# EAGLE design pocket_sdr_v2.2 (EAGLE 9.6.2)
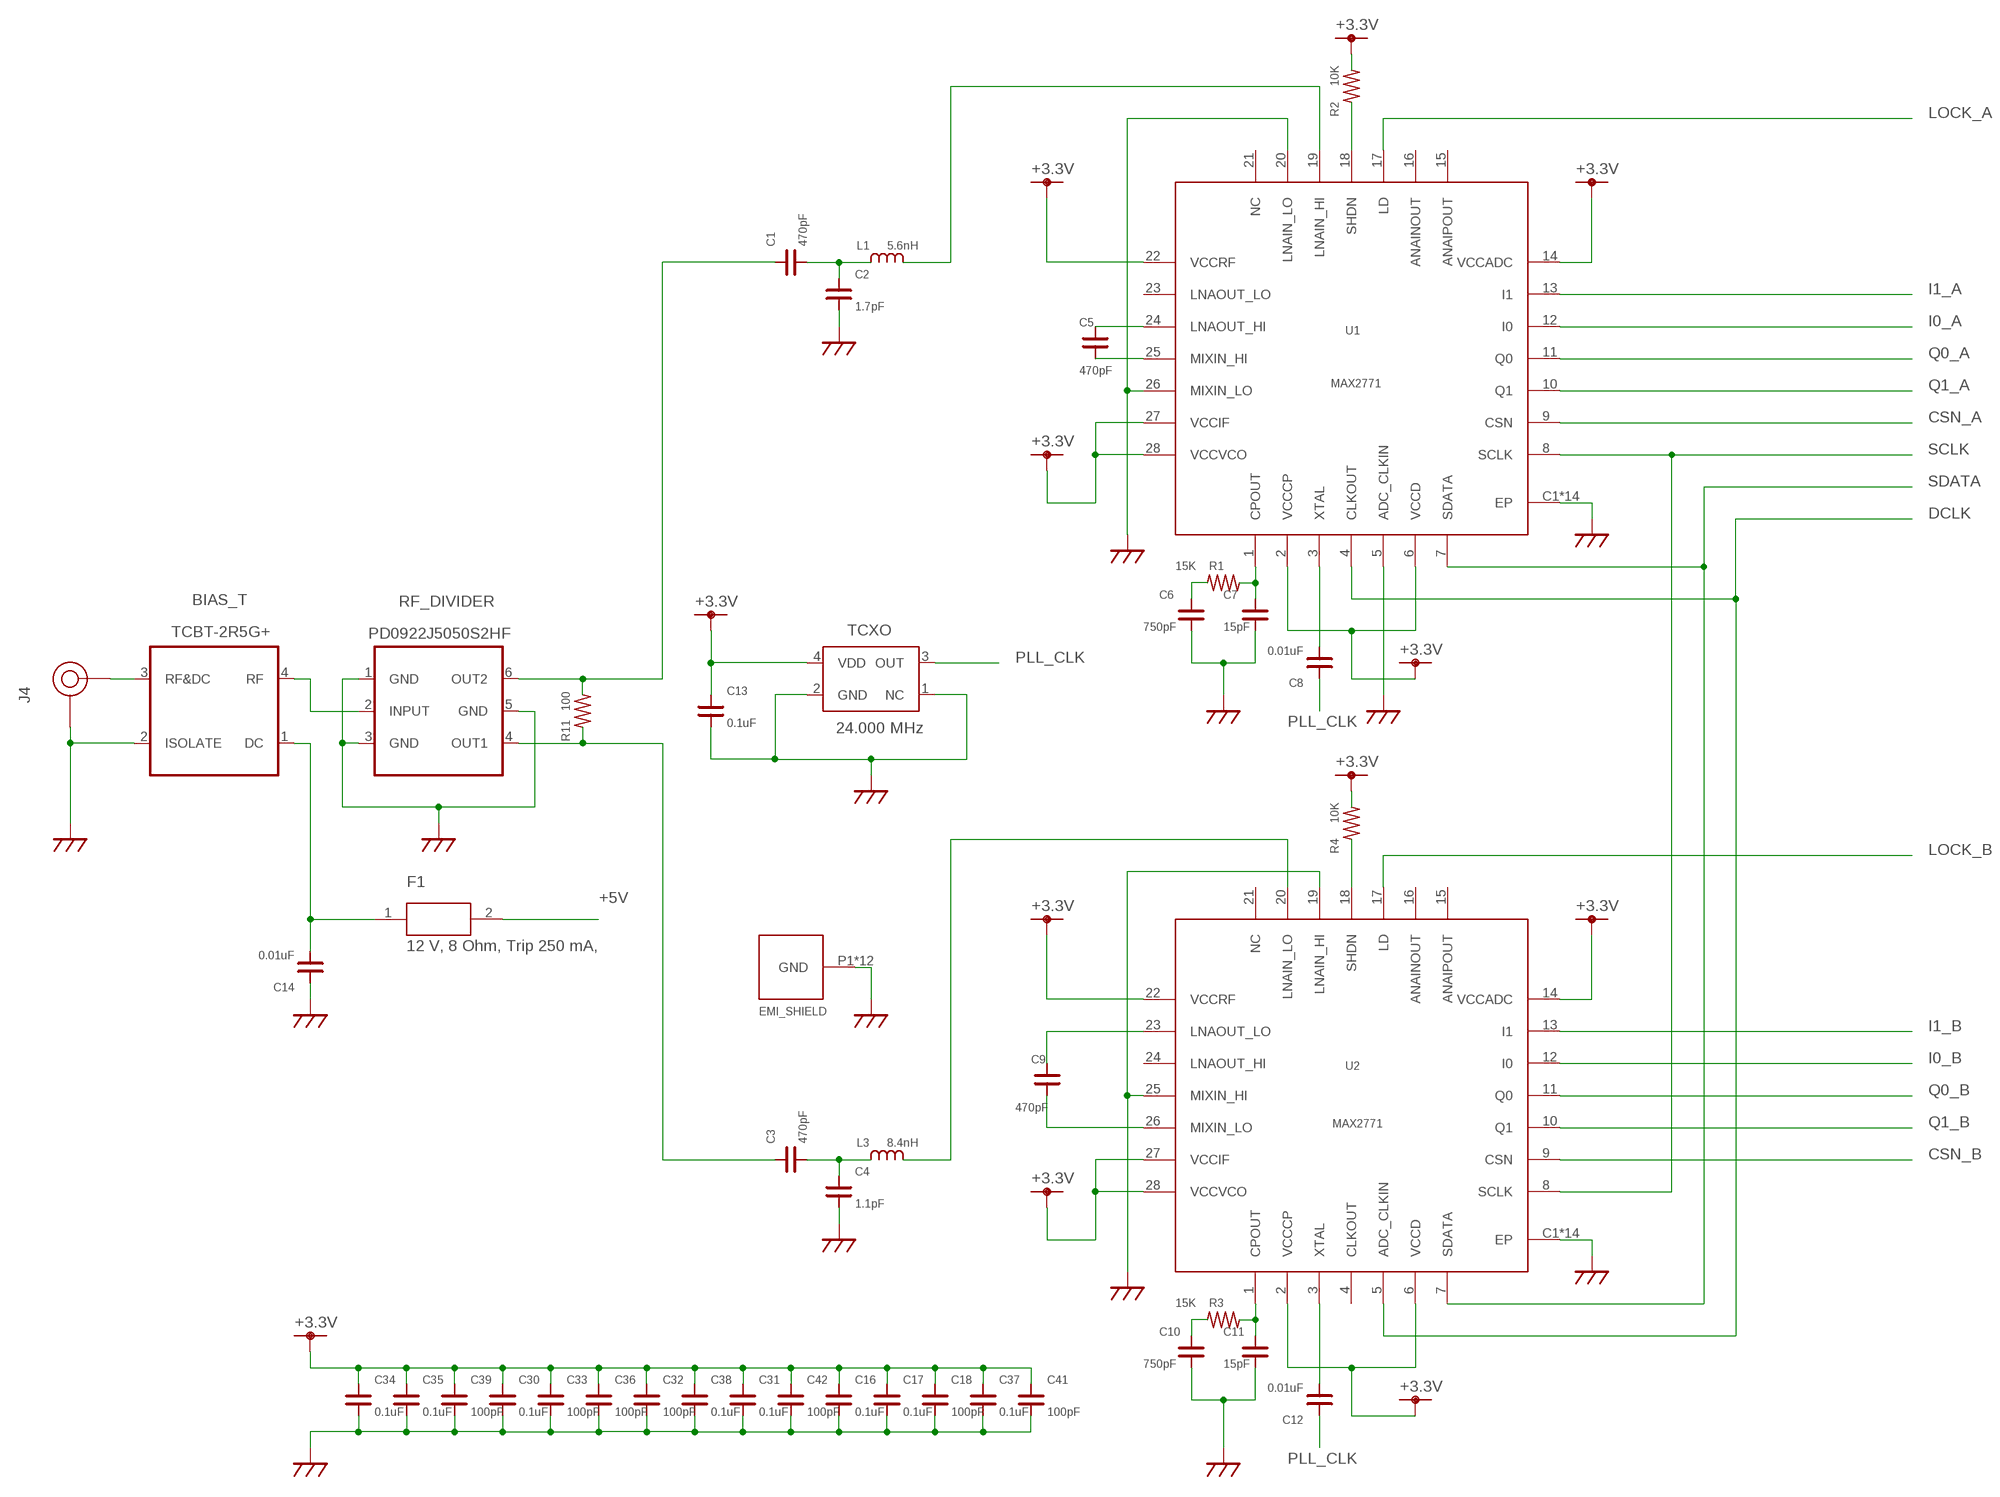
[diagram p0: schematic, sheet 1, part 1 of 2]
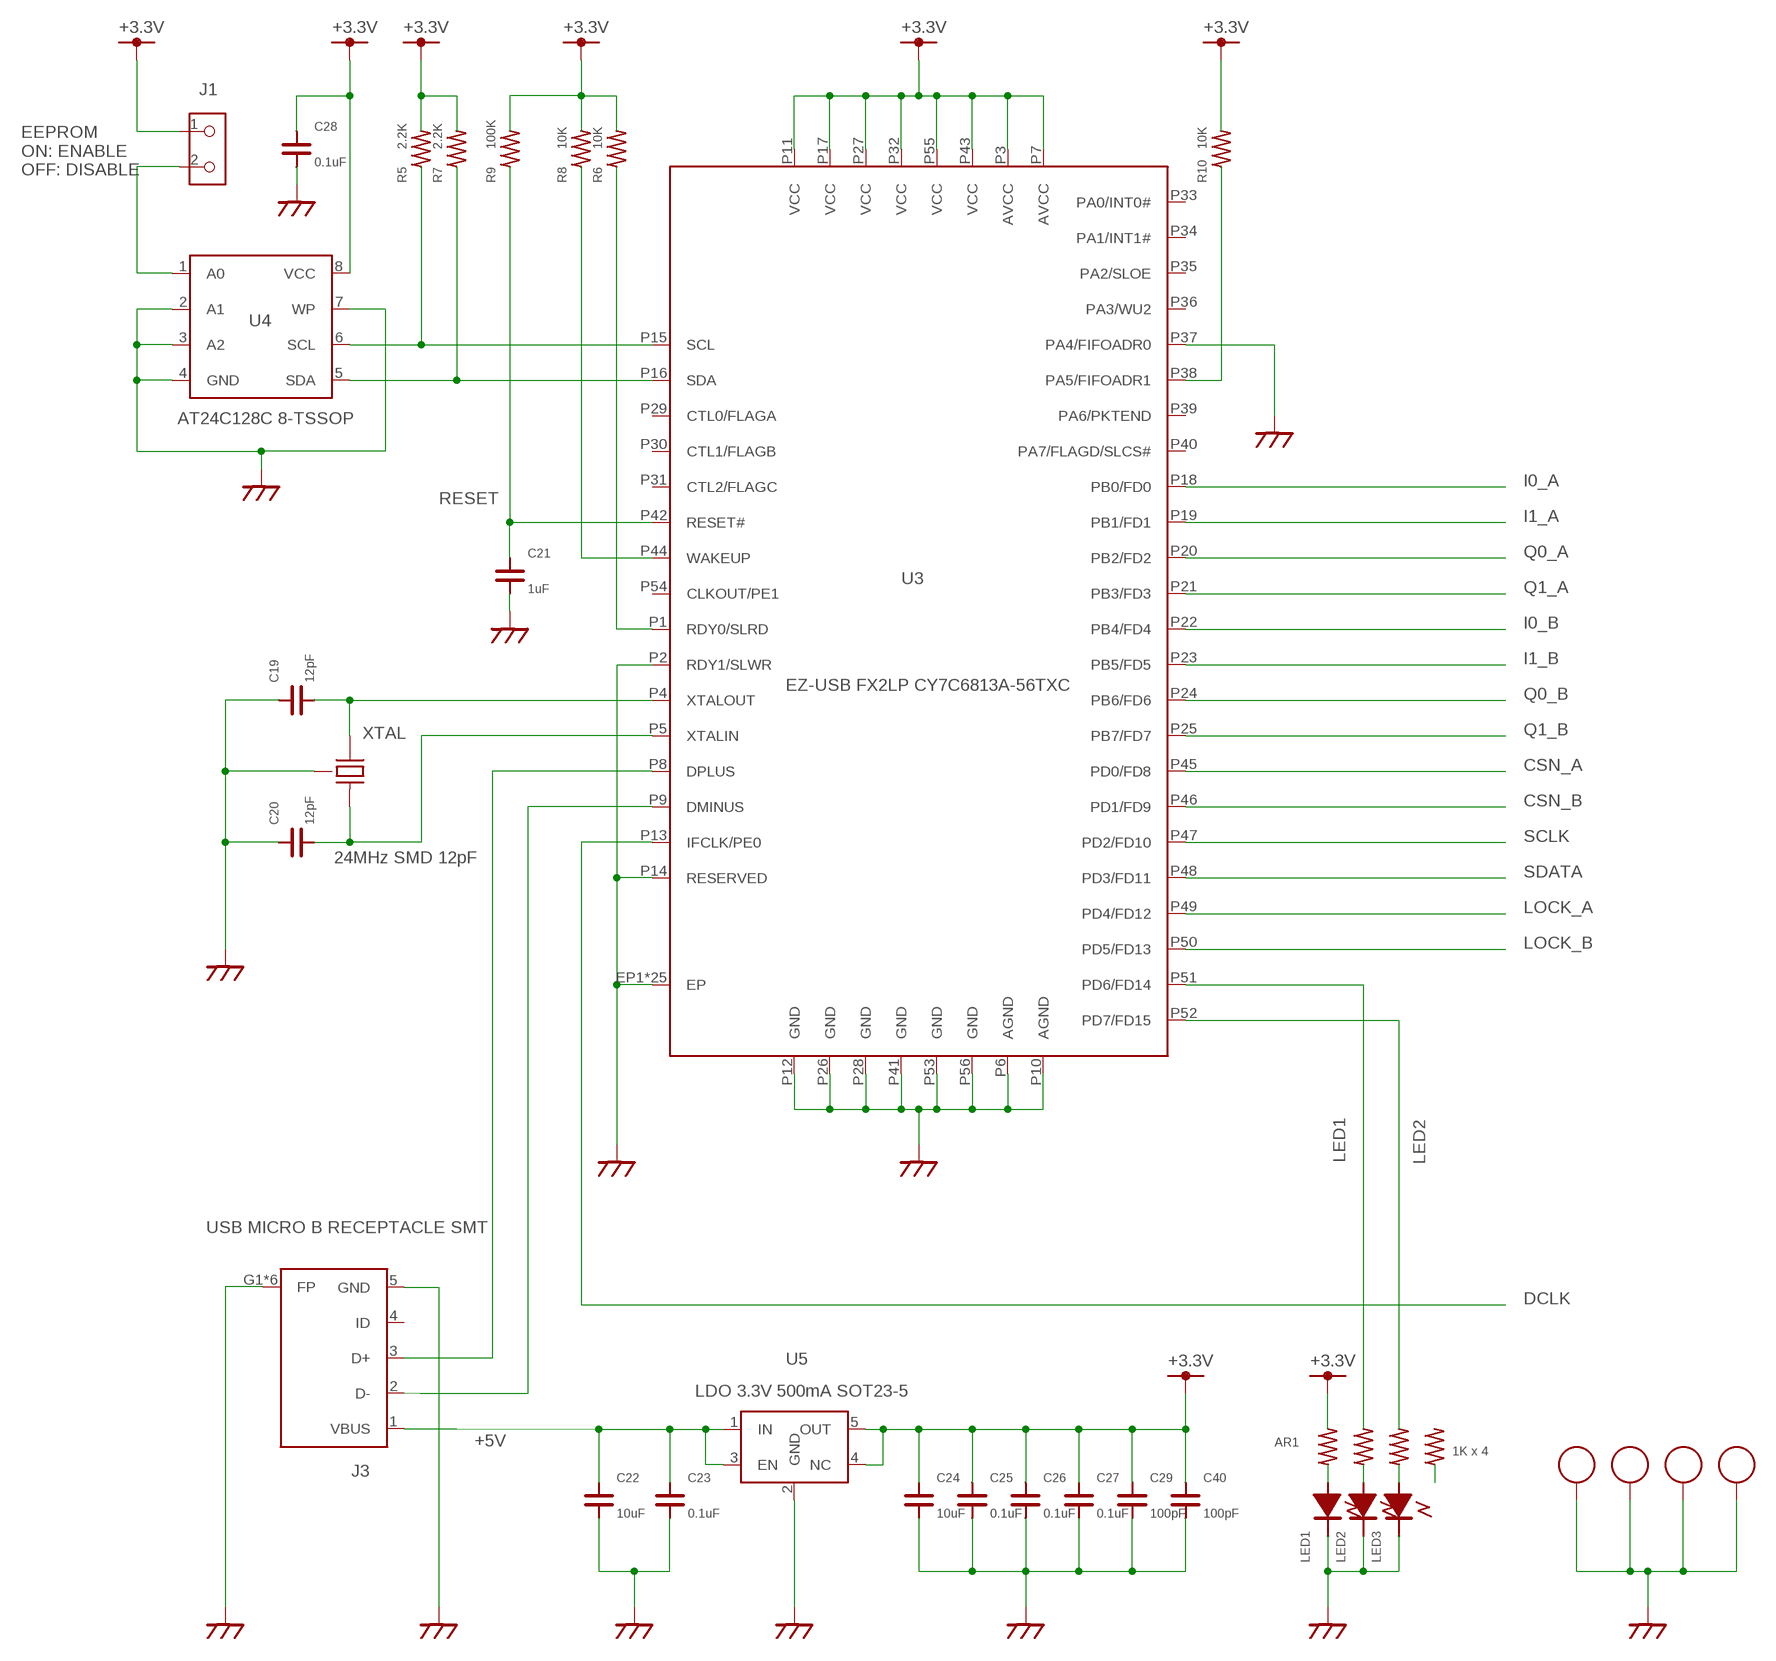
[diagram p1: schematic, sheet 1, part 2 of 2]

## Parts
AR1  1K x 4  ARRAY_REG__EXB28V  [EXB28V]
BIAS_T  TCBT-2R5G+  BIAS_T  [BIAS_T]
C1  470pF  C1005  [C1005]
C2  1.7pF  C1005  [C1005]
C3  470pF  C1005  [C1005]
C4  1.1pF  C1005  [C1005]
C5  470pF  C1005  [C1005]
C6  750pF  C1005  [C1005]
C7  15pF  C1005  [C1005]
C8  0.01uF  C1005  [C1005]
C9  470pF  C1005  [C1005]
C10  750pF  C1005  [C1005]
C11  15pF  C1005  [C1005]
C12  0.01uF  C1005  [C1005]
C13  0.1uF  C1005  [C1005]
C14  0.01uF  C1005  [C1005]
C16  0.1uF  C1005  [C1005]
C17  0.1uF  C1005  [C1005]
C18  100pF  C1005  [C1005]
C19  12pF  C1005  [C1005]
C20  12pF  C1005  [C1005]
C21  1uF  C1005  [C1005]
C22  10uF  C3225  [C3225]
C23  0.1uF  C1005  [C1005]
C24  10uF  C3225  [C3225]
C25  0.1uF  C1005  [C1005]
C26  0.1uF  C1005  [C1005]
C27  0.1uF  C1005  [C1005]
C28  0.1uF  C1005  [C1005]
C29  100pF  C1005  [C1005]
C30  0.1uF  C1005  [C1005]
C31  0.1uF  C1005  [C1005]
C32  100pF  C1005  [C1005]
C33  100pF  C1005  [C1005]
C34  0.1uF  C1005  [C1005]
C35  0.1uF  C1005  [C1005]
C36  100pF  C1005  [C1005]
C37  0.1uF  C1005  [C1005]
C38  0.1uF  C1005  [C1005]
C39  100pF  C1005  [C1005]
C40  100pF  C1005  [C1005]
C41  100pF  C1005  [C1005]
C42  100pF  C1005  [C1005]
F1  12 V, 8 Ohm, Trip 250 mA,  POLYSW1608  [C1608]
J1  PIN HEADER 2MM 2P  PINH_2MM_2P  [PINH-2MM-2P]
J3  USB MICRO B RECEPTACLE SMT  MICROUSB  [MICROUSB]
J4  SMA JACK EDGE MNT  SMA-ANG  [SMA-ANG]
L1  5.6nH  L1608  [C1608]
L3  8.4nH  L1608  [C1608]
LED1  LED1608 GREEN  LED1608  [LED_1608]
LED2  LED1608 BLUE  LED1608  [LED_1608]
LED3  LED1608 BLUE  LED1608  [LED_1608]
R1  15K  R1005  [C1005]
R2  10K  R1005  [C1005]
R3  15K  R1005  [C1005]
R4  10K  R1005  [C1005]
R5  2.2K  R1005  [C1005]
R6  10K  R1005  [C1005]
R7  2.2K  R1005  [C1005]
R8  10K  R1005  [C1005]
R9  100K  R1005  [C1005]
R10  10K  R1005  [C1005]
R11  100  R1005  [C1005]
RF-SHEILD-CASE  BMI-S-202-F BMI-S-202-C  BMI-S-202  [BMI-S-202]
RF_DIVIDER  PD0922J5050S2HF  RF_DIV  [RF_DIV]
TCXO  24.000 MHz  TCXO  [TCXO]
U1  MAX2771  [TQFN28]
U2  MAX2771  [TQFN28]
U3  EZ-USB FX2LP CY7C6813A-56TXC  CY7C6813A  [QFN56]
U4  AT24C128C 8-TSSOP  AT24C256C  [TSSOP_8P]
U5  LDO 3.3V 500mA SOT23-5  LDO_SOT  [SOT23]
U$53  CPAD_2.2MM  [CPAD_2.2MM]
U$54  CPAD_2.2MM  [CPAD_2.2MM]
U$55  CPAD_2.2MM  [CPAD_2.2MM]
U$58  CPAD_2.2MM  [CPAD_2.2MM]
XTAL  24MHz SMD 12pF  XTAL_SMD  [XTAL_SMD]

## Nets
+3.3V: AR1.2 C13.1 C16.1 C17.1 C18.1 C24.P$1 C25.1 C26.1 C27.1 C28.1 C29.1 C30.1 C31.1 C32.1 C33.1 C34.1 C35.1 C36.1 C37.1 C38.1 C39.1 C40.1 C41.1 C42.1 J1.1 R2.2 R4.2 R5.2 R6.2 R7.2 R8.2 R9.2 R10.2 TCXO.4(VDD) U1.2(VCCCP) U1.6(VCCD) U1.14(VCCADC) U1.22(VCCRF) U1.27(VCCIF) U1.28(VCCVCO) U2.2(VCCCP) U2.6(VCCD) U2.14(VCCADC) U2.22(VCCRF) U2.27(VCCIF) U2.28(VCCVCO) U3.P3(AVCC) U3.P7(AVCC) U3.P11(VCC) U3.P17(VCC) U3.P27(VCC) U3.P32(VCC) U3.P43(VCC) U3.P55(VCC) U4.8(VCC) U5.4(NC) U5.5(OUT)
+5V: C22.P$1 C23.1 F1.2 J3.1(VBUS) U5.1(IN) U5.3(EN)
CSN_A: U1.9(CSN) U3.P45(PD0/FD8)
CSN_B: U2.9(CSN) U3.P46(PD1/FD9)
DCLK: U1.4(CLKOUT) U2.5(ADC_CLKIN) U3.P13(IFCLK/PE0)
FIFOADR1: R10.1 U3.P38(PA5/FIFOADR1)
GND: BIAS_T.2(ISOLATE) C2.1 C4.2 C6.2 C7.2 C10.2 C11.2 C13.2 C14.1 C16.2 C17.2 C18.2 C19.1 C20.1 C21.2 C22.P$2 C23.2 C24.P$2 C25.2 C26.2 C27.2 C28.2 C29.2 C30.2 C31.2 C32.2 C33.2 C34.2 C35.2 C36.2 C37.2 C38.2 C39.2 C40.2 C41.2 C42.2 J3.5(GND) J3.G1(FP) J3.G2(FP) J3.G3(FP) J3.G4(FP) J3.G5(FP) J3.G6(FP) J4.P2(GND) J4.P3(GND) J4.P4(GND) J4.P5(GND) LED1.2 LED2.2 LED3.2 RF-SHEILD-CASE.P1(GND) RF-SHEILD-CASE.P2(GND) RF-SHEILD-CASE.P3(GND) RF-SHEILD-CASE.P4(GND) RF-SHEILD-CASE.P5(GND) RF-SHEILD-CASE.P6(GND) RF-SHEILD-CASE.P7(GND) RF-SHEILD-CASE.P8(GND) RF-SHEILD-CASE.P9(GND) RF-SHEILD-CASE.P10(GND) RF-SHEILD-CASE.P11(GND) RF-SHEILD-CASE.P12(GND) RF_DIVIDER.1(GND) RF_DIVIDER.3(GND) RF_DIVIDER.5(GND) TCXO.1(NC) TCXO.2(GND) U1.5(ADC_CLKIN) U1.20(LNAIN_LO) U1.26(MIXIN_LO) U1.C1(EP) U1.C2(EP) U1.C3(EP) U1.C4(EP) U1.EP U1.V1(EP) U1.V2(EP) U1.V3(EP) U1.V4(EP) U1.V5(EP) U1.V6(EP) U1.V7(EP) U1.V8(EP) U1.V9(EP) U2.19(LNAIN_HI) U2.25(MIXIN_HI) U2.C1(EP) U2.C2(EP) U2.C3(EP) U2.C4(EP) U2.EP U2.V1(EP) U2.V2(EP) U2.V3(EP) U2.V4(EP) U2.V5(EP) U2.V6(EP) U2.V7(EP) U2.V8(EP) U2.V9(EP) U3.EP1(EP) U3.EP2(EP) U3.EP3(EP) U3.EP4(EP) U3.EP5(EP) U3.P2(RDY1/SLWR) U3.P6(AGND) U3.P10(AGND) U3.P12(GND) U3.P14(RESERVED) U3.P26(GND) U3.P28(GND) U3.P37(PA4/FIFOADR0) U3.P41(GND) U3.P53(GND) U3.P56(GND) U3.P$1(EP) U3.P$2(EP) U3.P$3(EP) U3.P$4(EP) U3.P$5(EP) U3.P$6(EP) U3.P$7(EP) U3.P$8(EP) U3.P$9(EP) U3.P$10(EP) U3.P$11(EP) U3.P$12(EP) U3.P$13(EP) U3.P$14(EP) U3.P$15(EP) U3.P$16(EP) U3.P$17(EP) U3.P$18(EP) U3.P$19(EP) U3.P$20(EP) U4.2(A1) U4.3(A2) U4.4(GND) U4.7(WP) U5.2(GND) U$53.EP U$54.EP U$55.EP U$58.EP XTAL.P2(GND) XTAL.P4(GND)
I0_A: U1.12(I0) U3.P18(PB0/FD0)
I0_B: U2.12(I0) U3.P22(PB4/FD4)
I1_A: U1.13(I1) U3.P19(PB1/FD1)
I1_B: U2.13(I1) U3.P23(PB5/FD5)
LED1: AR1.4 U3.P51(PD6/FD14)
LED2: AR1.6 U3.P52(PD7/FD15)
LOCK_A: U1.17(LD) U3.P49(PD4/FD12)
LOCK_B: U2.17(LD) U3.P50(PD5/FD13)
N$1: C5.2 U1.25(MIXIN_HI)
N$2: C5.1 U1.24(LNAOUT_HI)
N$3: BIAS_T.3(RF&DC) J4.P1(RF)
N$4: BIAS_T.4(RF) RF_DIVIDER.2(INPUT)
N$5: BIAS_T.1(DC) C14.2 F1.1
N$6: R6.1 U3.P1(RDY0/SLRD)
N$8: AR1.3 LED2.1(+)
N$9: C1.2 C2.2 L1.1
N$10: C8.2 U1.3(XTAL)
N$11: AR1.7
N$12: L1.2 U1.19(LNAIN_HI)
N$13: AR1.1 LED1.1(+)
N$14: C1.1 R11.2 RF_DIVIDER.6(OUT2)
N$15: C9.2 U2.26(MIXIN_LO)
N$16: C9.1 U2.23(LNAOUT_LO)
N$17: C19.2 U3.P4(XTALOUT) XTAL.P1(XTAL1)
N$18: R2.1 U1.18(SHDN)
N$20: J3.3(D+) U3.P8(DPLUS)
N$22: C20.2 U3.P5(XTALIN) XTAL.P3(XTAL2)
N$23: AR1.5 LED3.1(+)
N$24: C7.1 R1.2 U1.1(CPOUT)
N$25: C6.1 R1.1
N$27: C11.1 R3.2 U2.1(CPOUT)
N$28: R7.1 U3.P16(SDA) U4.5(SDA)
N$29: R5.1 U3.P15(SCL) U4.6(SCL)
N$30: R8.1 U3.P44(WAKEUP)
N$32: C10.1 R3.1
N$33: J3.2(D-) U3.P9(DMINUS)
N$34: J1.2 U4.1(A0)
N$35: C3.1 R11.1 RF_DIVIDER.4(OUT1)
N$37: C3.2 C4.1 L3.1
N$38: L3.2 U2.20(LNAIN_LO)
N$42: R4.1 U2.18(SHDN)
N$43: C12.2 U2.3(XTAL)
PLL_CLK: C8.1 C12.1 TCXO.3(OUT)
Q0_A: U1.11(Q0) U3.P20(PB2/FD2)
Q0_B: U2.11(Q0) U3.P24(PB6/FD6)
Q1_A: U1.10(Q1) U3.P21(PB3/FD3)
Q1_B: U2.10(Q1) U3.P25(PB7/FD7)
RESET: C21.1 R9.1 U3.P42(RESET#)
SCLK: U1.8(SCLK) U2.8(SCLK) U3.P47(PD2/FD10)
SDATA: U1.7(SDATA) U2.7(SDATA) U3.P48(PD3/FD11)
Unconnected: AR1.8 J3.4(ID) U1.15(ANAIPOUT) U1.16(ANAINOUT) U1.21(NC) U1.23(LNAOUT_LO) U2.4(CLKOUT) U2.15(ANAIPOUT) U2.16(ANAINOUT) U2.21(NC) U2.24(LNAOUT_HI) U3.P29(CTL0/FLAGA) U3.P30(CTL1/FLAGB) U3.P31(CTL2/FLAGC) U3.P33(PA0/INT0#) U3.P34(PA1/INT1#) U3.P35(PA2/SLOE) U3.P36(PA3/WU2) U3.P39(PA6/PKTEND) U3.P40(PA7/FLAGD/SLCS#) U3.P54(CLKOUT/PE1)

## Notes on the sheet
- EEPROM
  ON: ENABLE
  OFF: DISABLE

## Library data of the parts
AR1 = ttaka_desc:ARRAY_REG__EXB28V
BIAS_T = ttaka_misc:BIAS_T
C1-C14 C16-C21 C23 C25-C42 = ttaka_desc:C1005
C22 C24 = ttaka_desc:C3225
F1 = ttaka_desc:POLYSW1608
J1 = ttaka_conn:PINH_2MM_2P
J3 = ttaka_conn:MICROUSB
J4 = ttaka_conn:SMA-ANG
L1 L3 = ublox:L1608
LED1-LED3 = ttaka_desc:LED1608
R1-R11 = ttaka_desc:R1005
RF-SHEILD-CASE = ttaka_misc:BMI-S-202
RF_DIVIDER = ttaka_misc:RF_DIV
TCXO = ttaka_misc:TCXO
U1 U2 = ttaka_ic:MAX2771
U3 = ttaka_ic:CY7C6813A
U4 = ttaka_ic:AT24C256C
U5 = ttaka_misc:LDO_SOT
U$53-U$55 U$58 = ttaka_misc:CPAD_2.2MM
XTAL = ttaka_misc:XTAL_SMD

## Board
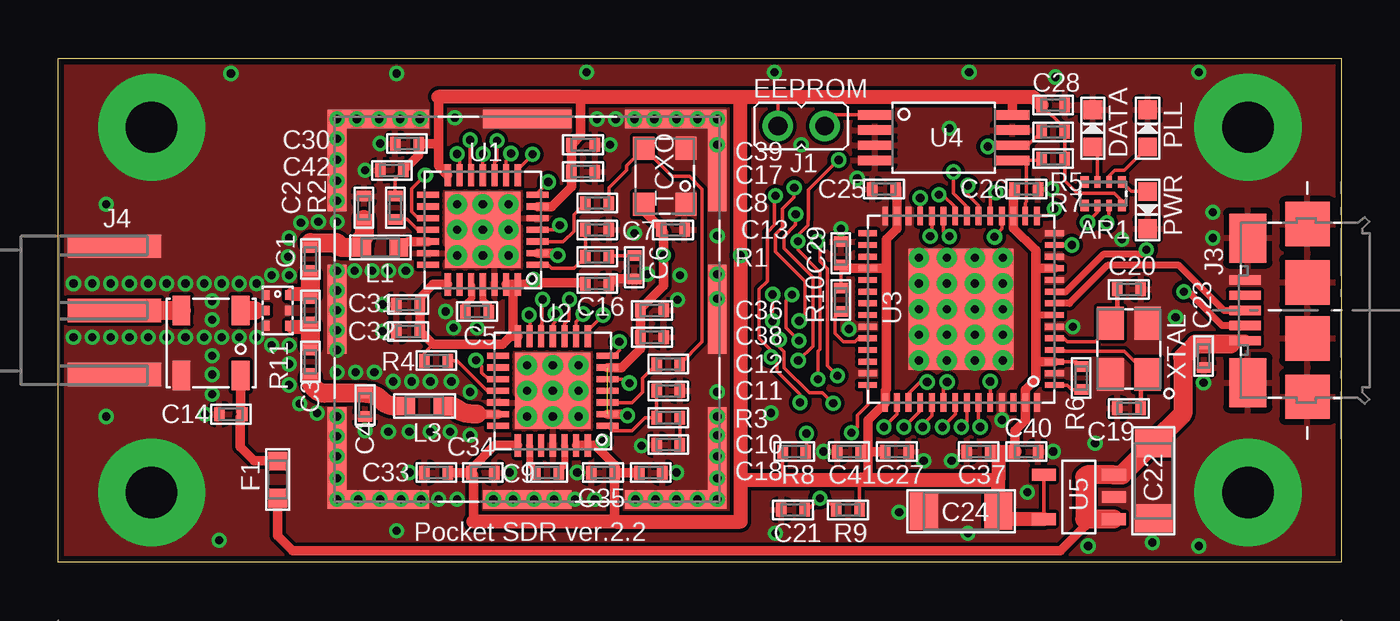
[diagram p2: board, top side]
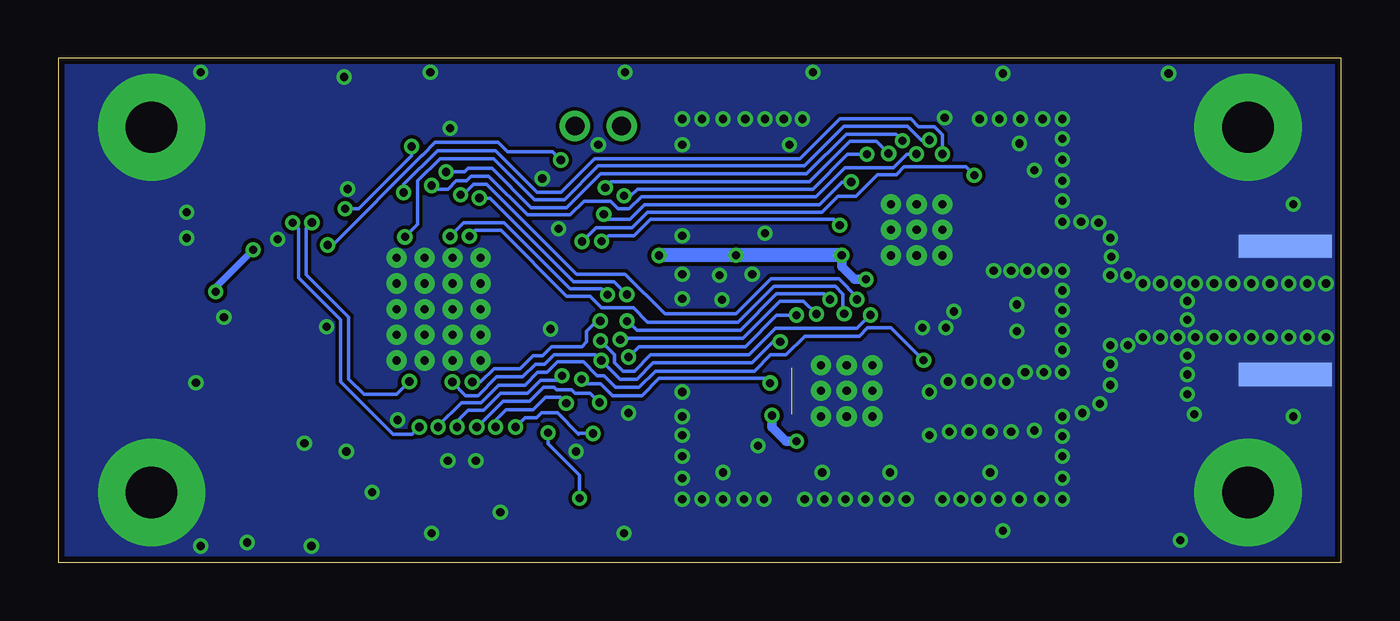
[diagram p3: board, bottom side, seen from below]

Size 55 x 21.6 mm. Coordinates in mm from the lower left corner, seen from the top.
Outline: 0,0 0,21.6 55,21.6 55,0 0,0
Copper layers (1*16): Top 0.035mm / dielectric 1.5mm / Bottom 0.035mm
Design rules "SeeedStudio_2layer_DRU_no_angle_20140221": minimum track width 6mil, minimum drill 12mil, track to track 6mil, track to pad 6mil, pad to pad 6mil, via to via 6mil, smd to smd 0mil, copper to edge 10mil, drill to drill 10mil, minimum pad ring 10mil, minimum via ring 6mil, stop-mask expansion 2mil, vias tented up to drill 100mil, thermal gap 10mil

### Footprints (pad centres in the part's own frame; a part is rotated, then mirrored left to right if it is on the bottom)
EXB28V = smd 0.35 x 0.5: 1 -0.8,-0.5; 2 -0.8,0.5; 7 0.8,-0.5; 8 0.8,0.5 | smd 0.25 x 0.5: 3 -0.25,-0.5; 4 -0.25,0.5; 5 0.25,-0.5; 6 0.25,0.5
BIAS_T = smd 0.762 x 1.27: 1 -1.27,1.397; 2 1.27,1.397; 3 1.27,-1.397; 4 -1.27,-1.397
C1005 = smd 0.45 x 0.6: 1 -0.5,0; 2 0.5,0
C3225 = smd 1.6 x 1.2: P$1 0,1.6; P$2 0,-1.6
C1608 = smd 0.8 x 0.8: 1 -0.8,0; 2 0.8,0
PINH-2MM-2P = drill 0.8: 1 0,-1; 2 0,1
MICROUSB = smd 0.4 x 1.35: 1 -1.3,4.125; 2 -0.65,4.125; 3 0,4.125; 4 0.65,4.125; 5 1.3,4.125 | smd 1.9 x 1.9: G1 -3.7,1.45; G2 3.7,1.45; G5 -1.2,1.45; G6 1.2,1.45 | smd 2.1 x 1.6: G3 -3.1,4; G4 3.1,4
SMA-ANG = smd 1 x 4: P1 0,-4; P2 -2.75,-4; P3 2.75,-4 | smd 1 x 4 bottom: P4 -2.75,-4; P5 2.75,-4
LED_1608 = smd 0.8 x 0.8: 1 -0.8,0; 2 0.8,0
BMI-S-202 = smd 4.35 x 0.8: P1 -6.375,-8.15; P3 6.375,-8.15; P7 6.375,8.15; P9 -6.375,8.15 | smd 3.8 x 0.8: P2 0,-8.15; P8 0,8.15 | smd 0.8 x 4.36: P4 8.15,-6.375; P6 8.15,6.375; P10 -8.15,6.375; P12 -8.15,-6.375 | smd 0.8 x 3.8: P5 8.15,0; P11 -8.15,0
RF_DIV = smd 0.41 x 0.33: 1 0.66,0.5; 2 0,0.5; 3 -0.66,0.5; 4 -0.66,-0.5; 5 0,-0.5; 6 0.66,-0.5
TCXO = smd 1 x 0.9: 1 -1.2,-0.9; 2 1.2,-0.9; 3 1.2,0.9; 4 -1.2,0.9
TQFN28 = smd 0.26 x 0.95: 1 -1.5,-2.34; 2 -1,-2.34; 3 -0.5,-2.34; 4 0,-2.34; 5 0.5,-2.34; 6 1,-2.34; 7 1.5,-2.34; 15 1.5,2.34; 16 1,2.34; 17 0.5,2.34; 18 0,2.34; 19 -0.5,2.34; 20 -1,2.34; 21 -1.5,2.34 | smd 0.95 x 0.26: 8 2.34,-1.5; 9 2.34,-1; 10 2.34,-0.5; 11 2.34,0; 12 2.34,0.5; 13 2.34,1; 14 2.34,1.5; 22 -2.34,1.5; 23 -2.34,1; 24 -2.34,0.5; 25 -2.34,0; 26 -2.34,-0.5; 27 -2.34,-1; 28 -2.34,-1.5 | smd 1.4 x 1.4: C1 -0.85,-0.85; C2 0.85,-0.85; C3 -0.85,0.85; C4 0.85,0.85 | smd 3.25 x 3.25: EP 0,0 | drill 0.35: V1 -1.1,-1.1; V2 0,-1.1; V3 1.1,-1.1; V4 -1.1,0; V5 0,0; V6 1.1,0; V7 -1.1,1.1; V8 0,1.1; V9 1.1,1.1
QFN56 = smd 5.2 x 4.5: EP1 0,0 | smd 2.4 x 2.05: EP2 -1.35,1.175; EP3 1.35,1.175; EP4 -1.35,-1.175; EP5 1.35,-1.175 | smd 0.25 x 0.8: P1 -3.25,-4; P2 -2.75,-4; P3 -2.25,-4; P4 -1.75,-4; P5 -1.25,-4; P6 -0.75,-4; P7 -0.25,-4; P8 0.25,-4; P9 0.75,-4; P10 1.25,-4; P11 1.75,-4; P12 2.25,-4; P13 2.75,-4; P14 3.25,-4; P29 3.25,4; P30 2.75,4; P31 2.25,4; P32 1.75,4; P33 1.25,4; P34 0.75,4; P35 0.25,4; P36 -0.25,4; P37 -0.75,4; P38 -1.25,4; P39 -1.75,4; P40 -2.25,4; P41 -2.75,4; P42 -3.25,4 | smd 0.8 x 0.25: P15 4,-3.25; P16 4,-2.75; P17 4,-2.25; P18 4,-1.75; P19 4,-1.25; P20 4,-0.75; P21 4,-0.25; P22 4,0.25; P23 4,0.75; P24 4,1.25; P25 4,1.75; P26 4,2.25; P27 4,2.75; P28 4,3.25; P43 -4,3.25; P44 -4,2.75; P45 -4,2.25; P46 -4,1.75; P47 -4,1.25; P48 -4,0.75; P49 -4,0.25; P50 -4,-0.25; P51 -4,-0.75; P52 -4,-1.25; P53 -4,-1.75; P54 -4,-2.25; P55 -4,-2.75; P56 -4,-3.25 | drill 0.35 pad 0.7: P$1 -1.1,1.8; P$2 1.1,1.8; P$3 0,1.8; P$4 -2.2,1.8; P$5 2.2,1.8; P$6 -2.2,0.6; P$7 -1.1,0.6; P$8 0,0.6; P$9 1.1,0.6; P$10 2.2,0.6; P$11 -2.2,-0.6; P$12 -1.1,-0.6; P$13 0,-0.6; P$14 1.1,-0.6; P$15 2.2,-0.6; P$16 -2.2,-1.8; P$17 -1.1,-1.8; P$18 0,-1.8; P$19 1.1,-1.8; P$20 2.2,-1.8
TSSOP_8P = smd 0.4 x 1.45: 1 -0.975,-2.95; 2 -0.325,-2.95; 3 0.325,-2.95; 4 0.975,-2.95; 5 0.975,2.95; 6 0.325,2.95; 7 -0.325,2.95; 8 -0.975,2.95
SOT23 = smd 0.508 x 1.016: 1 -0.95,-1.5; 2 0,-1.5; 3 0.95,-1.5; 4 0.95,1.5; 5 -0.95,1.5
CPAD_2.2MM = drill 2.2 pad 4.6: EP 0,0
XTAL_SMD = smd 1.4 x 1.15: P1 -1.1,-0.8; P2 1.1,-0.8; P3 1.1,0.8; P4 -1.1,0.8

### Placement (x,y rotation side)
AR1  44.8,15.8 180 top
BIAS_T  6.55,9.4 180 top
C1  10.8,13 90 top
C2  13.1,15.2 270 top
C3  10.8,8.6 270 top
C4  13.15,6.75 270 top
C5  17.95,10.75 0 top
C6  24.7,12.65 270 top
C7  23.1,14.25 0 top
C8  23.1,15.4 180 top
C9  20.95,3.85 0 top
C10  26.15,5.05 180 top
C11  26.15,7.35 0 top
C12  26.15,8.5 180 top
C13  26.35,14.25 0 top
C14  7.4,6.35 0 top
C16  23.1,11.95 0 top
C17  22.5,16.75 0 top
C18  25.4,3.85 0 top
C19  45.9,6.6 0 top
C20  45.9,11.7 180 top
C21  31.5,2.25 180 top
C22  46.95,3.5 0 top
C23  49.1,8.85 270 top
C24  38.7,2.2 270 top
C25  35.4,16 180 top
C26  41.5,16 0 top
C27  35.95,4.75 0 top
C28  42.65,19.6 0 top
C29  33.55,13.25 90 top
C30  14.95,17.95 180 top
C31  15,11.05 180 top
C32  15,9.9 180 top
C33  16.2,3.85 180 top
C34  18.2,3.85 0 top
C35  23.35,3.85 180 top
C36  25.45,10.8 0 top
C37  39.45,4.75 180 top
C38  25.45,9.65 0 top
C39  22.5,17.9 0 top
C40  41.5,4.75 0 top
C41  33.9,4.75 180 top
C42  14.3,16.8 180 top
F1  9.4,3.55 270 top
J1  31.85,18.7 270 top
J3  55,10.8 90 top
J4  -1.6,10.8 90 top
L1  13.8,13.5 0 top
L3  15.7,6.7 0 top
LED1  46.7,15.1 270 top
LED2  46.7,18.6 90 top
LED3  44.35,18.6 90 top
R1  23.1,13.1 180 top
R2  14.45,15.2 90 top
R3  26.15,6.2 180 top
R4  16.2,8.65 180 top
R5  42.65,18.45 0 top
R6  43.85,7.9 90 top
R7  42.65,17.3 0 top
R8  31.55,4.75 180 top
R9  33.85,2.25 0 top
R10  33.55,11.25 90 top
R11  10.8,10.8 90 top
RF-SHEILD-CASE  20.1,10.85 0 top
RF_DIVIDER  9.4,10.8 90 top
TCXO  26,16.55 90 top
U1  18.2,14.25 90 top
U2  21.2,7.35 90 top
U3  38.7,10.85 90 top
U4  37.95,18.2 270 top
U5  43.75,2.8 90 top
U$53  4,18.65 0 top
U$54  4,3 0 top
U$55  51,18.65 0 top
U$58  51,3 0 top
XTAL  45.9,9.15 90 top

### Tracks (layer width: path | path; a pad name or v marks a point on that pad's centre or on a via)
+3.3V  (via drill 0.35)  (1 unrouted)
  Top 0.152: 15.45,17.8 C30.1 | J1.1 30.85,19.95 | C42.1 14.45,16.45 R2.2 | R4.2 15.7,8.98 16.06,9.34 | C28.1 43.15,18.6 R5.2 R7.2 43.16,16.35 43.68,15.82 45.28,15.82 45.6,15.5 AR1.2 | R8.2 31.05,3.55 | U3.P3 43.65,8.6 R6.2 | R9.2 34.35,3.45 34.45,3.55 | R10.2 33.55,12.45 33.7,12.6 | U5.4 U5.5
  Top 0.305: U3.P7 41.9,10.6 | U2.22 | U2.27 22.22,5.01
  Top 0.406: 35.5,12.6 35.5,13.85 35.95,14.3 U3.P27 35.95,16.06 C25.1 | U3.P11 41.9,12.6 | 41.9,12.6 41.9,13.37 40.95,14.32 U3.P17 40.95,15.95 C26.1 | U1.22 16.06,11.91 15.5,11.35 C31.1 C32.1 16.06,9.34 19.05,9.34 19.4,9.69 U2.14 19.5,9.69 19.5,11.61 U1.27 U1.28 20.16,11.91 v20.37,12.13 20.52,11.98 22.57,11.98 C16.1 | v24.4,6.29 24.34,6.35 U2.2 | U1.2 21.32,13.25 v21.41,13.16 | 35.5,12.6 U3.P32 33.7,12.6 C29.1 | 35.5,12.6 35.5,7.43 35.45,7.38 U3.P43 34.7,6.1 34.7,4.8 | 41.9,12.6 41.9,10.6 41.9,8.6 41.95,8.6 | 41.95,8.6 U3.P3 | 41.95,8.6 41.9,8.55 41.9,7.85 41.45,7.4 U3.P55 41.45,6.1 41,5.65 C40.1 C37.1 | 22.4,19.95 22.4,18.3 C39.1 C17.1 22,16.1 21.15,15.25 U1.6 | TCXO.4 25.1,15.05 25.85,14.3 C13.1 25.95,14.15 v25.95,13.16 25.95,11.86 24.95,10.86 C36.1 C38.1 24.95,9.15 24.15,8.35 U2.6 | 16.3,19.95 16.3,17.95 | 16.3,17.95 16.3,16.99 U1.14 | 16.3,17.95 C30.1 | C35.1 23.85,4.19 23.1,4.94 v23.35,5.19 23.17,5.01 U2.28 22.22,5.01 | C34.1 17.8,3.75 17.8,1.74 | C34.1 C33.1 | C34.1 17.7,4 18.71,5.01 U2.22 | U4.8 40.9,19.8 41.05,19.95 | C42.1 15.45,17.45 15.45,17.8 | U4.8 40.92,19.2 | 34.45,3.55 34.7,3.8 34.7,4.75 | 34.7,4.8 34.7,4.75 | C41.1 34.45,4.8 34.7,4.8 | 34.7,4.75 C27.1 | U4.8 41.38,19.18 | C35.1 C18.1 | 23.88,1.76 23.9,1.74 | C35.1 23.85,1.74
  Top 0.61: 23.85,1.74 17.8,1.74 | 23.9,1.74 29.25,1.74 29.25,3.55 | 29.25,19.95 v29.25,13.15 29.25,3.55 | 16.3,19.95 22.4,19.95 29.25,19.95 | 29.25,19.95 30.85,19.95 41.05,19.95 41.8,19.95 C28.1 | U5.5 40.65,1.85 C24.P$1 40.3,3.55 | 29.25,3.55 31.05,3.55 34.45,3.55 40.3,3.55 | C40.1 40.3,4.75 40.3,3.55
  Bottom 0.406: v21.41,13.16 21.41,12.66 20.88,12.13 v20.37,12.13 | v23.35,5.19 23.8,5.19 24.4,5.79 v24.4,6.29
  Bottom 0.61: v21.41,13.16 v25.95,13.16 29.24,13.16 v29.25,13.15
+5V
  Top 0.406: 44,1.85 44,1.55 42.95,0.5 10.05,0.5 9.4,1.15 F1.2
  Top 0.508: J3.1 50.4,9.5 50.25,9.35
  Top 0.813: 50.25,9.35 C23.1 48.76,9.35 48.2,8.79 48.2,6.35 C22.P$1 45.6,3.75 U5.3 44.1,3.75 44,3.65 44,1.85 U5.1
CSN_A  (via drill 0.35)
  Top 0.152: v37.25,7.73 36.95,7.73 36.45,7.23 U3.P45 | v19.41,17.52 19.41,17.42 19.2,17.22 U1.9 | v31.55,16.06 31.55,15.66 31.05,15.16 31.05,14.36 30.75,14.06 30.75,13.3 32.02,12.04 32.02,10.59 v31.77,10.34
  Bottom 0.152: v37.25,7.73 36.89,7.73 36.32,8.3 35.2,8.3 34.65,8.85 34.25,8.85 33.85,9.25 32.55,9.25 32.35,9.45 32.35,9.9 31.91,10.34 v31.77,10.34 | v19.41,17.52 19.93,18.04 21.06,18.04 22.79,16.31 31.3,16.31 v31.55,16.06
CSN_B  (via drill 0.35)
  Top 0.152: U3.P46 36.95,6.5 v36.25,5.8 | U2.9 22.2,10.29 22.21,10.29 22.21,10.31 22.5,10.6 v22.5,10.64 | v30.91,9.54 30.91,9.24 31.12,9.03 31.12,8.35 32.2,7.27 32.77,7.27 v33.22,6.82
  Bottom 0.152: v22.5,10.64 23.05,11.2 24.06,11.2 25.66,9.6 30.86,9.6 v30.91,9.54 | v36.25,5.8 36.25,6.1 35.8,6.55 34.64,6.55 34.12,7.07 33.47,7.07 v33.22,6.82
DCLK  (via drill 0.35)
  Top 0.152: v24.48,7.68 24.31,7.85 U2.5 | U1.4 21.3,14.25 v21.5,14.45 | v32.57,7.84 32.57,9.04 32.66,9.14 32.66,12.44 31.71,13.39 v31.71,13.76 31.71,14.01 32.15,14.45 32.15,14.67 32.17,14.69 32.17,15.97 v33.45,17.25 | U3.P13 43.25,13.6 v43.45,13.6
  Bottom 0.152: v31.71,13.76 31.66,13.76 31.41,14.01 30.31,14.01 29.61,14.7 21.75,14.7 v21.5,14.45 | v24.48,7.68 24.68,7.88 29.25,7.88 29.98,7.15 31.25,7.15 31.75,7.65 32.37,7.65 v32.57,7.84 | v33.45,17.25 33.8,17.6 35.75,17.6 36.15,18 38.84,18 39.39,17.45 39.4,17.45 43.25,13.6 v43.45,13.6
FIFOADR1
  Top 0.152: U3.P38 34.3,9.6 34.14,9.44 33.67,9.44 33.3,9.81 33.3,10.5 R10.1
GND  (via drill 0.35)
  Top 0.406: C16.2 23.8,12.15 C6.2
  other vias: 3.05,9.65 3.85,9.65 2.25,11.95 3.05,11.95 3.85,11.95 4.65,11.95 2.25,9.65 4.65,9.65 49.5,13.9 17.65,7.3 13.45,12.5 12.7,12.5 14.9,12.5 9.15,9.3 9.9,9.3 9.9,8.5 9.9,7.6 12.75,8.15 17.65,5.45 14.35,7.75 15.15,7.75 15.95,7.75 16.85,7.75 38.2,18.6 9.9,12.3 9.9,13.9 17,19.05 28.25,19 28.25,2.7 24.7,19 25.55,19 27.4,19 26.5,19 15.5,19 14.65,19 13.75,19 12.8,19 11.95,19 11.95,18.15 11.95,17.25 11.95,16.35 11.95,15.5 11.95,12.5 11.95,11.65 11.95,10.8 11.95,9.95 11.95,6.25 11.95,5.4 11.95,4.55 11.95,3.6 11.95,2.7 12.85,2.7 13.8,2.7 14.7,2.7 15.55,2.7 18.65,2.7 19.5,2.7 20.4,2.7 21.25,2.7 24.75,2.7 25.6,2.7 26.5,2.7 27.4,2.7 28.25,3.6 28.25,4.55 28.25,5.45 28.25,6.25 10.35,6.8 10.4,14.55 49.1,7.7 6.25,11.95 7,11.95 6.25,9.65 7.75,9.65 7.75,11.95 2.05,15.35 2.05,6.25 22.65,21 30.7,21 39.05,21 48.9,0.7 48.9,21 6.9,0.95 7.4,20.95 15.05,5.6 14.15,5.6 15.95,5.6 16.8,5.6 13.55,8.15 11.95,9.1 19.35,3.85 14.5,20.95 1.45,11.95 1.45,9.65 49.5,15 28.25,17.9 28.25,14 28.25,12.35 28.25,11.3 23.1,19 26.55,11.25 17.1,2.7 16.6,10.75 15.05,3.85 47.9,10.5 44.45,5.1 33.9,10 45.6,13.85 43.5,10.1 31.85,17.9 5.45,11.95 9.15,12.3 7,9.65 37.1,4.35 30.55,6.4 25,5 32.8,4.75 24.7,14.1 23,2.7 42.6,16 0.65,11.95 0.65,9.65 14.5,1.35 30.75,1.25 39,1.25 44.15,0.7 6.6,7.2 13.8,17.95 13.15,16.8 13.9,11.05 13.9,9.9 22.25,3.85 26.5,3.85 25.25,12.35 23.65,17.9 38.3,4.35 42.65,4.75 34.25,16.45 33.55,14.3 36.05,2.15 46.9,0.85 42.75,20.8 28.25,7.3 16.3,2.7 22.15,2.7 23.9,19 40.45,6.1 5.45,9.65 13.15,5.65 6.3,6.35 6.6,8.85 6.6,8.05 26.65,12.3 6.6,10.4 6.6,11.2 17.95,10.05 16.95,10.05 41.55,3 11.1,6.4 11.15,14.6 9.85,13.1 11.95,8.15 8.5,11.95 8.5,9.65 14.15,12.5 11.95,14.6
  pour Top: -14,31 -14,-12 65,-12 65,31
  pour Bottom: -15,32 -15,-13 66,-13 66,32
I0_A  (via drill 0.35)
  Top 0.152: v17.66,18.1 17.66,17.08 17.7,17.04 U1.12 | U3.P18 40.45,14.3 40.14,13.99 v40.14,13.95
  Bottom 0.152: v17.66,18.1 18,18.1 18.6,18.7 21.31,18.7 23.02,16.99 31.86,16.99 33.3,15.55 34.59,15.55 36.34,17.3 38.64,17.3 39.59,16.35 39.59,14.5 v40.14,13.95
I0_B  (via drill 0.35)
  Top 0.152: v37.76,15.76 37.91,15.76 38.45,15.21 U3.P22 | U2.12 20.7,10.18 20.74,10.22 20.74,11.25 v20.76,11.27
  Bottom 0.152: v37.76,15.76 37.64,15.76 37.2,16.2 36.63,16.2 32.78,12.35 30.7,12.35 29,10.65 25.95,10.65 24.45,12.15 21.54,12.15 20.76,11.37 v20.76,11.27
I1_A  (via drill 0.35)
  Top 0.152: v40.2,15.85 39.95,15.6 U3.P19 | v17.1,17.5 17.2,17.4 U1.13
  Bottom 0.152: v17.1,17.5 17.1,18.33 17.45,18.68 18.12,18.68 18.45,19 21.5,19 23.2,17.3 32.02,17.3 33.45,15.87 34.47,15.87 36.25,17.65 38.75,17.65 40.2,16.2 v40.2,15.85
I1_B  (via drill 0.35)
  Top 0.152: U2.13 20.23,9.72 20.23,10.55 v20.18,10.6 | v38.2,13.97 38.18,13.97 37.95,14.2 U3.P23 | v31.46,11.47 31.21,11.22 31.21,10.04 v31.75,9.5
  Bottom 0.152: v20.18,10.6 20.21,10.6 20.77,10.04 24.25,10.04 25.39,8.9 29.6,8.9 30.3,8.2 30.8,8.2 31.15,8.55 31.15,8.9 v31.75,9.5 | v38.2,13.97 37.62,14.55 35.9,14.55 33.07,11.72 31.71,11.72 v31.46,11.47
LED1  (via drill 0.35)
  Top 0.152: v39.52,5.8 39.45,5.88 U3.P51 | AR1.4 45.05,14.65 v44.95,14.55
  Bottom 0.152: v39.52,5.8 39.83,5.5 40.65,5.5 42.9,7.75 42.9,10.4 44.7,12.2 44.7,14.3 v44.95,14.55
LED2  (via drill 0.35)
  Top 0.152: v44.13,14.57 v44.13,14.58 44.55,15 AR1.6 | v39.95,7.75 U3.P52
  Bottom 0.152: v44.13,14.57 44.38,14.32 44.38,12.33 42.55,10.5 42.55,7.85 41.9,7.2 40.5,7.2 v39.95,7.75
LOCK_A  (via drill 0.35)
  Top 0.152: U1.17 15.82,14.79 15.39,14.79 15.16,15.03 15.16,16.02 v15.73,16.59 | v32.55,13.75 32.65,13.65 32.65,12.9 32.97,12.58 32.97,8.43 v33.4,8 | U3.P49 38.45,6.35 v37.91,5.8
  Bottom 0.152: v37.91,5.8 37.91,6.05 37.44,6.52 36.76,6.52 36.03,7.25 34.88,7.25 34.32,7.81 33.59,7.81 v33.4,8 | v32.55,13.75 31.95,14.35 30.4,14.35 29.74,15.01 22.26,15.01 21.57,15.7 20.8,15.7 19.89,16.61 19.07,16.61 18.74,16.94 16.08,16.94 v15.73,16.59
LOCK_B  (via drill 0.35)
  Top 0.152: U2.17 18.44,7.84 18.16,8.12 18.16,8.41 v17.91,8.66 | U3.P50 38.95,6.04 v38.71,5.8
  Bottom 0.152: v38.71,5.8 38.71,5.85 37.72,6.84 36.87,6.84 36.12,7.6 35,7.6 34.45,8.15 34.04,8.15 33.6,8.59 32.49,8.59 31.9,8 31.6,8 31.1,7.5 30.1,7.5 29.4,8.2 25.16,8.2 24.47,8.89 23.8,8.89 23,9.7 20.65,9.7 20.31,10.04 19.29,10.04 v17.91,8.66
N$1
  Top 0.305: U1.25 18.2,11.26 18.45,11.01 C5.2
N$2
  Top 0.152: U1.24
  Top 0.305: U1.24 17.71,11.29 17.45,11.03 C5.1
N$3
  Top 0.813: J4.P1 BIAS_T.3
N$4
  Top 0.305: 8.4,10.8 RF_DIVIDER.2
  Top 0.813: BIAS_T.4 8.4,10.8
N$5
  Top 0.406: BIAS_T.1 7.82,6.43 C14.2 7.8,6.25 7.8,4.95 8.4,4.35 F1.1
N$6
  Top 0.152: U3.P1 43.25,7.6 43.45,7.4 R6.1
N$8
  Top 0.152: LED2.1 45.7,16.8 45.3,16.8 45.05,16.55 AR1.3
N$9
  Top 0.152: C1.2 10.8,13.7
  Top 0.813: 10.8,13.7 11.89,13.7 arc-83 12.04,13.56 arc45 12.2,13.5 L1.1 13,13.85 13.1,13.95 C2.2
N$10
  Top 0.152: U1.3 21.65,13.75 22.1,14.2 22.1,14.9 C8.2
N$12
  Top 0.406: U1.19 15.11,13.75 arc45 14.75,13.6 14.7,13.6 L1.2
N$13
  Top 0.152: AR1.1 46,15.9 LED1.1
N$14
  Top 0.152: C1.1 10.85,12.45 10.85,12.35 10.8,12.3 | 10.8,11.5 10.9,11.4 R11.2 | RF_DIVIDER.6 10,11.46 10.04,11.5
  Top 0.305: R11.2 10.6,11.5
  Top 0.61: 10.6,11.5 10.04,11.5
  Top 0.813: 10.8,12.3 10.8,11.5
N$15
  Top 0.305: U2.26 21.71,4.19 21.45,3.93 C9.2
N$16
  Top 0.305: U2.23 20.2,4.2 20.45,3.95 C9.1
N$17
  Top 0.152: XTAL.P1 45.7,9.05 43.15,9.05 43.1,9.1 U3.P4
  Top 0.203: XTAL.P1 46.4,7.75 C19.2
N$18
  Top 0.152: R2.1 14.95,14.7 15.4,14.25 U1.18
N$20
  Top 0.305: J3.3 49.97,10.8 48.04,12.73 44.98,12.73 43.35,11.1 U3.P8
N$22
  Top 0.152: U3.P5 43.1,9.6 43.25,9.45 44.45,9.45 45.1,10.1 XTAL.P3
  Top 0.203: C20.2 45.4,10.55 XTAL.P3
N$23
  Top 0.152: LED3.1 44.55,17.6 AR1.5
N$24
  Top 0.152: U1.1 20.99,12.75 21.14,12.6 22.1,12.6 R1.2 C7.1
N$25
  Top 0.152: R1.1 23.65,13.15 C6.1
N$27
  Top 0.152: U2.1 23.74,5.65 24.6,5.65 25.15,6.2 R3.2 C11.1
N$28
  Top 0.152: U3.P16 41.45,15.4 41.5,15.45 41.5,17.12 41.4,17.23 U4.5 42.08,17.23 R7.1
N$29  (via drill 0.35)
  Top 0.152: U4.6 40.85,17.82 v39.85,17.82 41.52,17.82 R5.1 | U3.P15 42.4,14.85 v42.7,15.15
  Bottom 0.152: v42.7,15.15 42.13,15.15 39.85,17.43 v39.85,17.82
N$30  (via drill 0.35)
  Top 0.152: U3.P44 35.95,6.35 v35.4,5.8 | v32.08,5.53 32.08,4.88 32.05,4.85 R8.1
  Bottom 0.152: v35.4,5.8 35,6.2 34.49,6.2 34.28,6.41 33.61,6.41 32.7,5.5 32.67,5.53 v32.08,5.53
N$32
  Top 0.152: R3.1 C10.1
N$33  (via drill 0.35)
  Top 0.305: U3.P9 43.2,11.6 44.8,13.2 46.45,13.2 v46.65,13.4 | v48.25,11.6 48.45,11.6 49.9,10.15 J3.2
  Bottom 0.305: v48.25,11.6 48.25,11.8 v46.65,13.4
N$34
  Top 0.152: U4.1 33.23,19.18 32.85,18.8 J1.2
N$35
  Top 0.152: R11.1 10.8,10.2 10.8,10.1 | C3.1 10.8,9.3 | RF_DIVIDER.4 9.99,10.04 10.04,10.09
  Top 0.305: 10.69,10.09 10.8,10.2
  Top 0.61: 10.04,10.09 10.69,10.09
  Top 0.813: 10.8,10.1 10.8,9.3
N$37
  Top 0.152: C3.2 10.8,7.9
  Top 0.508: 13.83,6.97 13.85,6.95 | 14.45,6.7 L3.1
  Top 0.813: 13.83,6.97 arc45 C4.1 11.45,7.25 arc-90 10.8,7.9 | 13.85,6.95 arc45 14.45,6.7
N$38
  Top 0.406: U2.20 17.93,6.35
  Top 0.813: L3.2 16.68,6.7 arc-45 17.27,6.46 arc18 17.93,6.35
N$42
  Top 0.152: U2.18 18.39,7.35 17.09,8.65 R4.1
N$43
  Top 0.152: U2.3 24.6,6.85 25.05,7.3 25.05,7.9 C12.2
PLL_CLK
  Top 0.152: C12.1 27.6,9.45 27.6,16 27.05,16.55 26.3,16.55 TCXO.3 24.35,17 24.35,16.8 23.6,16.05 C8.1
Q0_A  (via drill 0.35)
  Top 0.152: U3.P20 39.45,15.3 39,15.75 v39,16.15 | U1.11 v18.2,17.5 v18.21,17.5
  Bottom 0.152: v39,16.15 38.85,16 38.3,16 37.95,16.35 37.5,16.35 37.3,16.55 36.55,16.55 34.89,14.89 33.05,14.89 32.47,15.47 31.32,15.47 31,15.14 30.52,15.14 30,15.67 22.51,15.67 21.27,16.91 19.2,16.91 18.61,17.5 v18.21,17.5
Q0_B  (via drill 0.35)
  Top 0.152: U2.11 21.2,10.2 21.31,10.31 v21.31,10.65 | U3.P24 37.45,14.05 v37.38,13.97
  Bottom 0.152: v21.31,10.65 21.36,10.7 21.36,11.5 21.68,11.82 24.33,11.82 25.85,10.3 29.73,10.3 30.35,10.91 31.71,10.91 32.2,11.4 33.2,11.4 36.02,14.22 37.12,14.22 v37.38,13.97
Q1_A  (via drill 0.35)
  Top 0.152: v38.38,16.73 38.38,15.82 38.95,15.25 U3.P21 | v18.81,18.07 v18.8,18.06 18.8,17.24 18.7,17.14 U1.10
  Bottom 0.152: v38.38,16.73 37.58,16.73 37.43,16.88 36.41,16.88 34.73,15.2 33.2,15.2 31.75,16.65 22.93,16.65 21.22,18.36 19.09,18.36 v18.81,18.07
Q1_B  (via drill 0.35)
  Top 0.152: U2.10 21.7,10.22 21.9,10.42 21.9,11.25 v21.92,11.27 | v36.95,15.61 36.95,15.56 U3.P25 | v30.62,10.34 v30.62,11.48
  Bottom 0.152: v21.92,11.27 22.17,11.52 24.2,11.52 25.76,9.96 30.19,9.96 30.57,10.34 v30.62,10.34 | v36.95,15.61 36.5,15.61 32.91,12.03 31.17,12.03 v30.62,11.48
RESET  (via drill 0.35)
  Top 0.152: U3.P42 34.7,6.75 34.25,6.3 34.25,5.8 v34,5.55 | C21.1 32.15,2.25 v32.65,2.75 32.85,2.75 R9.1
  Bottom 0.152: v34,5.55 34,5.09 32.65,3.74 v32.65,2.75
SCLK  (via drill 0.35)
  Top 0.152: U1.8 19.7,16.84 20.34,17.48 20.32,17.48 v20.33,17.49 | U2.8 22.7,9.95 v23.35,10.6 | v30.75,15.71 30.7,15.66 30.7,14.46 30.39,14.15 30.39,12.04 30.05,11.7 30.05,9.6 30.55,9.1 v30.55,8.8 30.81,8.54 30.81,8.19 31.8,7.2 v31.8,6.85 | U3.P47 37.45,6.29 37.06,5.9 v37.06,5.8
  Bottom 0.152: v20.33,17.49 21.16,17.49 22.65,16 30.17,16 30.46,15.71 v30.75,15.71 | v30.55,8.8 30.1,9.25 25.55,9.25 24.2,10.6 v23.36,10.6 v23.35,10.6 | v37.06,5.8 37.04,5.8 35.94,6.9 34.8,6.9 34.2,7.5 33.74,7.5 33.64,7.4 33,7.4 32.85,7.25 32.2,7.25 v31.8,6.85
SDATA  (via drill 0.35)
  Top 0.152: v21.01,16.3 20.5,15.79 U1.7 | v31.61,14.92 31.61,14.47 31.1,13.96 31.1,13.47 32.35,12.22 32.35,9.27 31.73,8.65 v31.72,8.65 | U2.7 23.8,8.85 24.05,9.1 v24.05,9.45 | U3.P48 37.95,7.57 v38.11,7.73
  Bottom 0.152: v38.11,7.73 37.53,7.15 37,7.15 36.2,7.95 35.1,7.95 34.55,8.5 34.15,8.5 33.75,8.9 31.97,8.9 v31.72,8.65 30.92,7.85 30.2,7.85 29.5,8.55 25.25,8.55 24.35,9.45 v24.05,9.45 | v21.01,16.3 21.41,16.3 22.38,15.33 29.87,15.33 30.5,14.7 31.39,14.7 v31.61,14.92

### Text on the board
tNames: EEPROM | PLL | DATA | PWR | U3 | Pocket SDR ver.2.2